# Altium schematic sheet pca20072_panel_breakout.SchDoc: =BoardTitle
size A4; Organization: Nordic Semiconductor; DocumentNumber: 4; SheetNumber: 4; SheetTotal: 6; CompanyName: Nordic Semiconductor; DocumentSize: A4
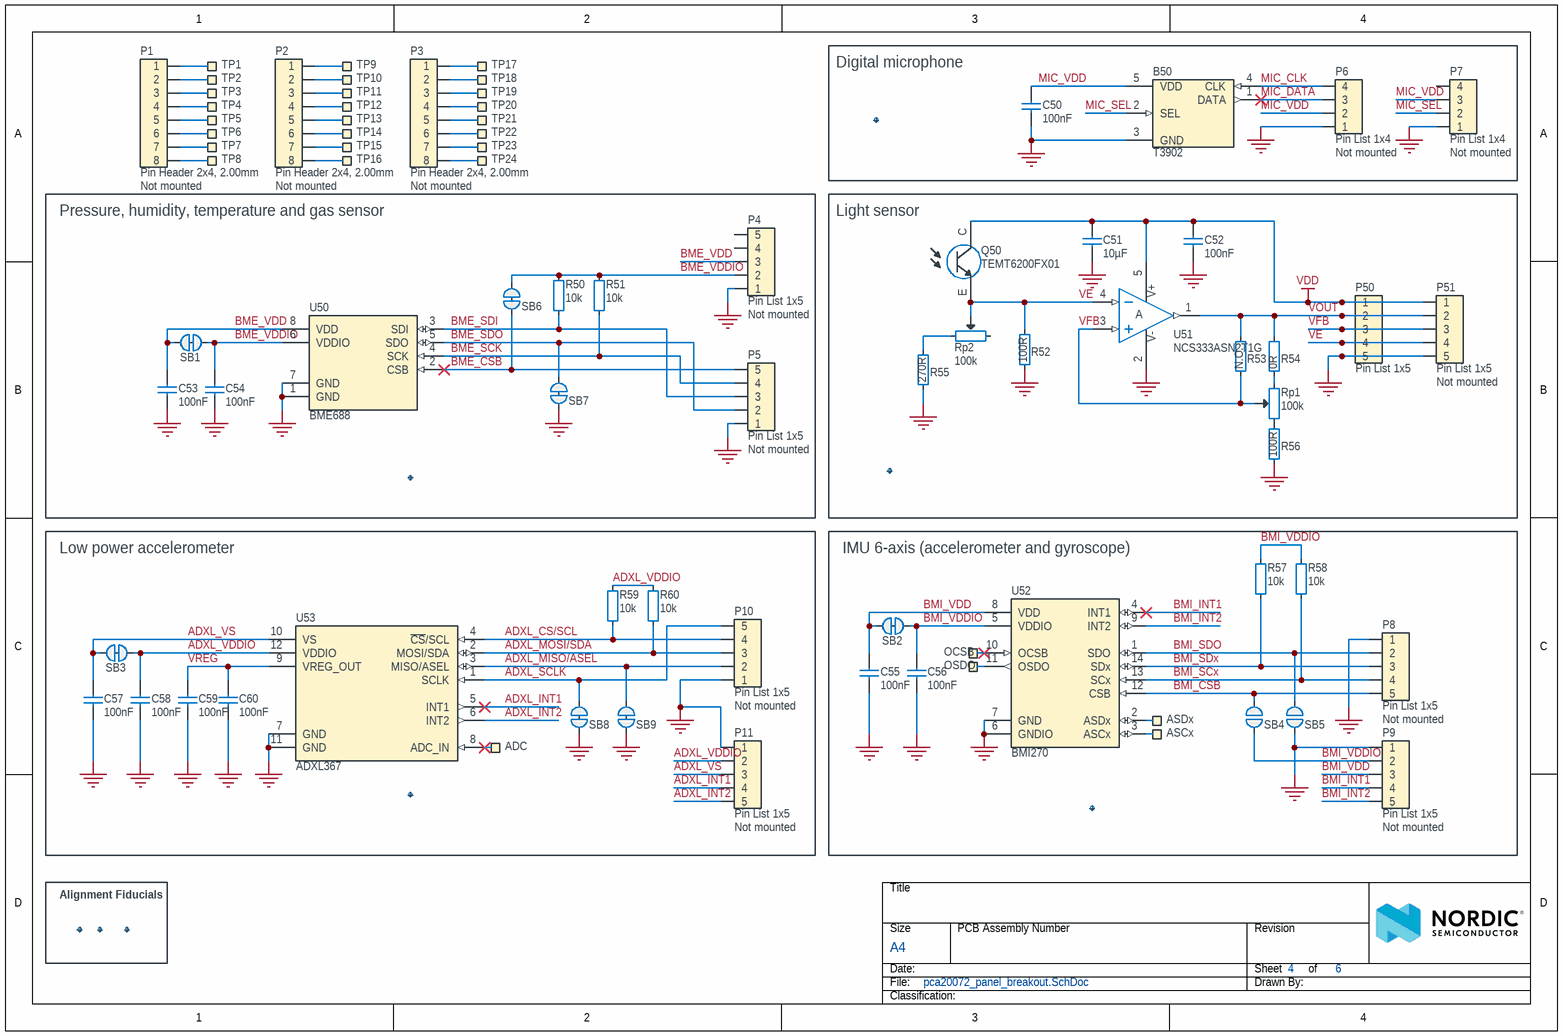
[diagram p0: pca20072_panel_breakout.SchDoc]

## Parts
ADC  Ø1.2mm,SMD  [TP_SMD_D1.2mm]  (value not drawn)  (no BOM)
ASCx  Ø1.2mm,SMD  [TP_SMD_D1.2mm]  (value not drawn)  (no BOM)
ASDx  Ø1.2mm,SMD  [TP_SMD_D1.2mm]  (value not drawn)  (no BOM)
B50  T3902  [T3902]
C50  100nF  [CAPC0603X03L_C]
C51  10µF  [CAPC1005X04L_C2]
C52  100nF  [CAPC0603X03L_C]
C53  100nF  [CAPC0603X03L_C]
C54  100nF  [CAPC0603X03L_C]
C55  100nF  [CAPC0603X03L_C]
C56  100nF  [CAPC0603X03L_C]
C57  100nF  [CAPC0603X03L_C]
C58  100nF  [CAPC0603X03L_C]
C59  100nF  [CAPC0603X03L_C]
C60  100nF  [CAPC0603X03L_C]
Fid50  Fiducial mark  [Fiducial]  (value not drawn)
Fid51  Fiducial mark  [Fiducial]  (value not drawn)
Fid52  Fiducial mark  [Fiducial]  (value not drawn)
Fid53  Fiducial mark  [Fiducial]  (value not drawn)
Fid54  Fiducial mark  [Fiducial]  (value not drawn)
Fid55  Fiducial mark  [Fiducial]  (value not drawn)
Fid56  Fiducial mark  [Fiducial]  (value not drawn)
Fid57  Fiducial mark  [Fiducial]  (value not drawn)
OCSB  Ø1.2mm,SMD  [TP_SMD_D1.2mm]  (value not drawn)  (no BOM)
OSDO  Ø1.2mm,SMD  [TP_SMD_D1.2mm]  (value not drawn)  (no BOM)
P1  Pin Header 2x4, 2.00mm  Assembly: Not mounted  [HDR_2x4_TH_2.00MM-NC]
P2  Pin Header 2x4, 2.00mm  Assembly: Not mounted  [HDR_2x4_TH_2.00MM-NC]
P3  Pin Header 2x4, 2.00mm  Assembly: Not mounted  [HDR_2x4_TH_2.00MM-NC]
P4  Pin List 1x5  Assembly: Not mounted  [LIST_1x5-NC]
P5  Pin List 1x5  Assembly: Not mounted  [LIST_1x5-NC]
P6  Pin List 1x4  Assembly: Not mounted  [LIST_1x4-NC]
P7  Pin List 1x4  Assembly: Not mounted  [LIST_1x4-NC]
P8  Pin List 1x5  Assembly: Not mounted  [LIST_1x5-NC]
P9  Pin List 1x5  Assembly: Not mounted  [LIST_1x5-NC]
P10  Pin List 1x5  Assembly: Not mounted  [LIST_1x5-NC]
P11  Pin List 1x5  Assembly: Not mounted  [LIST_1x5-NC]
P50  Pin List 1x5  [LIST_1x5_SMD]
P51  Pin List 1x5  Assembly: Not mounted  [LIST_1x5-NC]
Q50  TEMT6200FX01  [TEMT6200FX01]
R50  10k  [RESC1005X04L]
R51  10k  [RESC1005X04L]
R52  100R  [RESC1005X04L]
R53  N.C.  [RESC1005X04L_NC]
R54  0R  [RESC1005X04L]
R55  270R  [RESC1005X04L]
R56  100R  [RESC1005X04L]
R57  10k  [RESC1005X04L]
R58  10k  [RESC1005X04L]
R59  10k  [RESC1005X04L]
R60  10k  [RESC1005X04L]
Rp1  100k  [POT.TRIM_23B]
Rp2  100k  [POT.TRIM_23B]
SB1  Solderbridge  [Solderbridge_Shorted]  (value not drawn)  (net tie, no BOM)
SB2  Solderbridge  [Solderbridge_Shorted]  (value not drawn)  (net tie, no BOM)
SB3  Solderbridge  [Solderbridge_Shorted]  (value not drawn)  (net tie, no BOM)
SB4  Solderbridge  [Solderbridge]  (value not drawn)  (no BOM)
SB5  Solderbridge  [Solderbridge]  (value not drawn)  (no BOM)
SB6  Solderbridge  [Solderbridge_Shorted]  (value not drawn)  (net tie, no BOM)
SB7  Solderbridge  [Solderbridge_Shorted]  (value not drawn)  (net tie, no BOM)
SB8  Solderbridge  [Solderbridge_Shorted]  (value not drawn)  (net tie, no BOM)
SB9  Solderbridge  [Solderbridge_Shorted]  (value not drawn)  (net tie, no BOM)
TP1  TP  [TESTPAD-TH]  (value not drawn)  (no BOM)
TP2  TP  [TESTPAD-TH]  (value not drawn)  (no BOM)
TP3  TP  [TESTPAD-TH]  (value not drawn)  (no BOM)
TP4  TP  [TESTPAD-TH]  (value not drawn)  (no BOM)
TP5  TP  [TESTPAD-TH]  (value not drawn)  (no BOM)
TP6  TP  [TESTPAD-TH]  (value not drawn)  (no BOM)
TP7  TP  [TESTPAD-TH]  (value not drawn)  (no BOM)
TP8  TP  [TESTPAD-TH]  (value not drawn)  (no BOM)
TP9  TP  [TESTPAD-TH]  (value not drawn)  (no BOM)
TP10  TP  [TESTPAD-TH]  (value not drawn)  (no BOM)
TP11  TP  [TESTPAD-TH]  (value not drawn)  (no BOM)
TP12  TP  [TESTPAD-TH]  (value not drawn)  (no BOM)
TP13  TP  [TESTPAD-TH]  (value not drawn)  (no BOM)
TP14  TP  [TESTPAD-TH]  (value not drawn)  (no BOM)
TP15  TP  [TESTPAD-TH]  (value not drawn)  (no BOM)
TP16  TP  [TESTPAD-TH]  (value not drawn)  (no BOM)
TP17  TP  [TESTPAD-TH]  (value not drawn)  (no BOM)
TP18  TP  [TESTPAD-TH]  (value not drawn)  (no BOM)
TP19  TP  [TESTPAD-TH]  (value not drawn)  (no BOM)
TP20  TP  [TESTPAD-TH]  (value not drawn)  (no BOM)
TP21  TP  [TESTPAD-TH]  (value not drawn)  (no BOM)
TP22  TP  [TESTPAD-TH]  (value not drawn)  (no BOM)
TP23  TP  [TESTPAD-TH]  (value not drawn)  (no BOM)
TP24  TP  [TESTPAD-TH]  (value not drawn)  (no BOM)
U50  BME688  [BME680]
U51  NCS333ASN2T1G  [SOT95P275X110-5N]
U52  BMI270  [BMI270]
U53  ADXL367  [LGA50P220X230X97-12N]

## Blocks framed on the sheet
Digital microphone: B50 C50 Fid50 P6 P7
Pressure, humidity, temperature and gas sensor: C53 C54 Fid52 P4 P5 R50 R51 SB1 SB6 SB7 U50
Light sensor: C51 C52 Fid51 P50 P51 Q50 R52-R56 Rp1 Rp2 U51
Low power accelerometer: ADC C57-C60 Fid54 P10 P11 R59 R60 SB3 SB8 SB9 U53
IMU 6-axis (accelerometer and gyroscope): ASCx ASDx C55 C56 Fid53 OCSB OSDO P8 P9 R57 R58 SB2 SB4 SB5 U52
Alignment Fiducials: Fid55-Fid57

## Nets
GND: B50.3(GND) C50.1 C51.2 C52.2 C53.1 C54.1 C55.1 C56.1 C57.1 C58.1 C59.1 C60.1 P4.1 P5.1 P6.1 P7.1 P8.1 P9.1 P10.1 P11.1 P50.5 P51.5 R52.1 R55.1 R56.1 SB5.2 SB7.2 SB8.2 SB9.2 U50.1(GND) U50.7(GND) U51.2(VSS) U52.6(GNDIO) U52.7(GND) U53.7(GND) U53.11(GND)
VDD: C51.1 C52.1 P50.1 P51.1 Q50.C U51.5(VDD)
ADXL_CS/SCL: P10.4 R59.2 U53.4(~{CS}/SCL)
ADXL_INT1: P11.4 U53.5(INT1)
ADXL_INT2: P11.5 U53.6(INT2)
ADXL_MISO/ASEL: P10.2 SB9.1 U53.3(MISO/ASEL)
ADXL_MOSI/SDA: P10.3 R60.2 U53.2(MOSI/SDA)
ADXL_SCLK: P10.5 SB8.1 U53.1(SCLK)
ADXL_VDDIO: C58.2 P11.2 R59.1 R60.1 SB3.2 U53.12(VDDIO)
ADXL_VS: C57.2 P11.3 SB3.1 U53.10(VS)
BME_CSB: P5.5 SB6.1 U50.2(CSB)
BME_SCK: P5.4 R51.2 U50.4(SCK)
BME_SDI: P5.3 R50.2 U50.3(SDI)
BME_SDO: P5.2 SB7.1 U50.5(SDO)
BME_VDD: C53.2 P4.3 SB1.2 U50.8(VDD)
BME_VDDIO: C54.2 P4.2 R50.1 R51.1 SB1.1 SB6.2 U50.6(VDDIO)
BMI_CSB: P8.5 SB4.1 U52.12(CSB)
BMI_INT1: P9.4 U52.4(INT1)
BMI_INT2: P9.5 U52.9(INT2)
BMI_SCx: P8.4 R58.2 U52.13(SCx)
BMI_SDO: P8.2 SB5.1 U52.1(SDO)
BMI_SDx: P8.3 R57.2 U52.14(SDx)
BMI_VDD: C55.2 P9.3 SB2.1 U52.8(VDD)
BMI_VDDIO: C56.2 P9.2 R57.1 R58.1 SB2.2 SB4.2 U52.5(VDDIO)
MIC_CLK: B50.4(CLK) P6.4
MIC_DATA: B50.1(DATA) P6.3
MIC_SEL: B50.2(SEL) P7.2
MIC_VDD: B50.5(VDD) C50.2 P6.2 P7.3
VE: P50.4 P51.4 Q50.E R52.2 Rp2.3 U51.4(IN-)
VFB: P50.3 P51.3 R53.1 Rp1.3 U51.3(IN+)
VOUT: P50.2 P51.2 R53.2 R54.2 U51.1(OUT)
VREG: C59.2 C60.2 U53.9(VREG_OUT)
NetADC_1: ADC.1 U53.8(ADC_IN)
NetASCx_1: ASCx.1 U52.3(ASCx)
NetASDx_1: ASDx.1 U52.2(ASDx)
NetOCSB_1: OCSB.1 U52.10(OCSB)
NetOSDO_1: OSDO.1 U52.11(OSDO)
NetP1_1: P1.1 TP1.1
NetP1_2: P1.2 TP2.1
NetP1_3: P1.3 TP3.1
NetP1_4: P1.4 TP4.1
NetP1_5: P1.5 TP5.1
NetP1_6: P1.6 TP6.1
NetP1_7: P1.7 TP7.1
NetP1_8: P1.8 TP8.1
NetP2_1: P2.1 TP9.1
NetP2_2: P2.2 TP10.1
NetP2_3: P2.3 TP11.1
NetP2_4: P2.4 TP12.1
NetP2_5: P2.5 TP13.1
NetP2_6: P2.6 TP14.1
NetP2_7: P2.7 TP15.1
NetP2_8: P2.8 TP16.1
NetP3_1: P3.1 TP17.1
NetP3_2: P3.2 TP18.1
NetP3_3: P3.3 TP19.1
NetP3_4: P3.4 TP20.1
NetP3_5: P3.5 TP21.1
NetP3_6: P3.6 TP22.1
NetP3_7: P3.7 TP23.1
NetP3_8: P3.8 TP24.1
NetR54_1: R54.1 Rp1.1
NetR55_2: R55.2 Rp2.2
NetR56_2: R56.2 Rp1.2

Not connected (* = marked no-connect by the designer): P4 4 5; P7 4; Rp2 1

## Notes on the sheet
- Title
- Size
- Date:
- File:
- A4
- PCB Assembly Number
- Drawn By:
- Revision
- Sheet
- of
- Classification:
- (in symbol NCS333ASN2T1G) V+; A; V-

## Library data of the parts
ADC ASCx ASDx OCSB OSDO = TP_SMD_Ø1.2MM: 1.2mm circular SMD testpad; Manufacturer: Nordic Semiconductor; Manufacturer Part Number: N.A.; Part number NEMS: 100500476; Component Status: Active; Pad Count: 1; Part Number: TP_SMD_Ø1.2MM; PartId: 100500476; Component Class: Connectors; Author: rsk; ComponentLink1URL: N.A.; ComponentLink1Description: Datasheet; ComponentLink2URL: N.A.; ComponentLink2Description: Supplier link; HelpURL: N.A.; LatestRevisionDate: 2021-03-05; Published: 2019-10-09; Footprint Doc: TP_SMD_Ø1.2mm; Value: Ø1.2mm,SMD; Note: N.A.; Supplier 1: N.A.; Supplier Part Number 1: N.A.; Supplier 2: N.A.; Supplier Part Number 2: N.A.; Artikkelnr Noca: N.A.; Part number IPS: N.A.; Part number Norautron: N.A.
B50 = MMICT3902‐00‐012: Bottom Port PDM Low‐Power Multi‐Mode Microphone With High AOP Mode; Manufacturer: TDK Corporation; Part number NEMS: 101900855; Component Status: Active; Pad Count: 5; Note: N.A.; Part Number: MMICT3902‐00‐012; Component Class: Misc_ICs; Author: rubr; Manufacturer Part Number: MMICT3902‐00‐012; ComponentLink1URL: https://invensense.tdk.com/wp-content/uploads/2020/05/DS-000357-T3902-v1.0.pdf; ComponentLink1Description: Datasheet; ComponentLink2URL: https://www.digikey.com/en/products/detail/tdk-invensense/MMICT390200012/12746024; ComponentLink2Description: Supplier link; HelpURL: https://invensense.tdk.com/products/digital/t3902/; LatestRevisionDate: 2025-01-30; Published: 2025-01-30; Footprint Doc: T3902; Value: T3902; Supplier 1: Digi-Key; Supplier Part Number 1: 1428-MMICT390200012CT-ND; Supplier 2: N.A.; Supplier Part Number 2: N.A.; Artikkelnr Noca: N.A.; Part number IPS: N.A.; Part number Norautron: N.A.; PartId: 101900855
C50 C53 C54 C57-C60 = C0201-100n: Capacitor, X5R, ±10%, 100nF, 16V; Manufacturer: N.A.; Part number IPS: 00000001248, 00000002505; Part number Norautron: 262071862; Part number NEMS: 100200078; Component Status: Active; Pad Count: 2; Part Number: C0201-100n; Manufacturer Part Number: N.A.; Footprint Doc: 0201; LatestRevisionDate: 2024-06-27; Published: 2014-11-13; Value: 100nF; Note: 16V; Artikkelnr Noca: N.A.; ComponentLink1URL: N.A.; ComponentLink1Description: Datasheet; ComponentLink2URL: N.A.; ComponentLink2Description: Supplier link; HelpURL: N.A.; Supplier 1: N.A.; Supplier Part Number 1: N.A.; Supplier 2: N.A.; Supplier Part Number 2: N.A.; PartId: 100200078; Component Class: Capacitors; Author: rsk
C51 = C0402-10µ-6.3V-X5R-GRM155R60J106ME05D: Capacitor, X5R, ±20%, 6.3V; Manufacturer: Murata; Part number NEMS: 100200554; Pad Count: 2; Artikkelnr Noca: N.A.; Component Status: Active; Part Number: C0402-10µ-6.3V-X5R-GRM155R60J106ME05D; PartId: 100200554; Component Class: Capacitors; Author: eisk; Manufacturer Part Number: GRM155R60J106ME05D; ComponentLink1URL: https://www.murata.com/products/productdetail?partno=GRM155R60J106ME05%23; ComponentLink1Description: Datasheet; ComponentLink2URL: N.A.; ComponentLink2Description: Supplier link; HelpURL: https://www.murata.com/products/productdetail?partno=GRM155R60J106ME05%23; Footprint Doc: 0402; LatestRevisionDate: 2023-08-01; Published: 2023-08-01; Value: 10µF; Note: 6.3V; Supplier 1: Digi-Key; Supplier Part Number 1: 490-GRM155R60J106ME05DTR-ND; Supplier 2: Mouser; Supplier Part Number 2: 81-GRM155C81C225KE1D; Part number IPS: N.A.; Part number Norautron: N.A.
C52 C55 C56 = C0201-100n: Capacitor, X5R, ±10%, 100nF, 16V; Manufacturer: N.A.; Part number IPS: 00000001248, 00000002505; Part number Norautron: 262071862; Part number NEMS: 100200078; Pad Count: 2; Component Status: Active; Part Number: C0201-100n; PartId: 100200078; Component Class: Capacitors; Author: rsk; Manufacturer Part Number: N.A.; ComponentLink1URL: N.A.; ComponentLink1Description: Datasheet; ComponentLink2URL: N.A.; ComponentLink2Description: Supplier link; HelpURL: N.A.; Footprint Doc: 0201; LatestRevisionDate: 2024-06-27; Published: 2014-11-13; Value: 100nF; Note: 16V; Supplier 1: N.A.; Supplier Part Number 1: N.A.; Supplier 2: N.A.; Supplier Part Number 2: N.A.; Artikkelnr Noca: N.A.
Fid50-Fid57 = Fid-Mark: Manufacturer: N.A.; Part number NEMS: 100500073; Value: N.A.; Pad Count: 1; Component Status: Active; System: Connector; Part Number: Fid-Mark; Manufacturer Part Number: N.A.; LatestRevisionDate: 2009-12-12; Published: 2009-12-12; Note: N.A.; Artikkelnr Noca: N.A.; Footprint Doc: Fiducial; PartId: 100500073; Component Class: Connectors; Author: rsk; ComponentLink1URL: N.A.; ComponentLink1Description: Datasheet; ComponentLink2URL: N.A.; ComponentLink2Description: Supplier link; HelpURL: N.A.; Supplier 1: N.A.; Supplier Part Number 1: N.A.; Supplier 2: N.A.; Supplier Part Number 2: N.A.; Part number IPS: N.A.; Part number Norautron: N.A.
P1-P3 = Pin Header 2x4 TH, 2.00mm, N.C.: Pin Header 2x4, TH, 2.00mm; Manufacturer: N.A.; Part number NEMS: 100500252; Component Status: Active; Pad Count: 6; System: Connector; Part Number: Pin Header 2x4 TH, 2.00mm, N.C.; PartId: 100500252; Component Class: Connectors; Author: rsk; Manufacturer Part Number: N.A.; ComponentLink1URL: N.A.; ComponentLink1Description: Datasheet; ComponentLink2URL: N.A.; ComponentLink2Description: Supplier link; HelpURL: N.A.; LatestRevisionDate: 2019-01-21; Published: 2019-01-21; Footprint Doc: HDR_2x4_TH_2.00MM-NC; Value: Pin Header 2x4, 2.00mm; Note: N.A.; Supplier 1: N.A.; Supplier Part Number 1: N.A.; Supplier 2: N.A.; Supplier Part Number 2: N.A.; Artikkelnr Noca: N.A.; Part number IPS: N.A.; Part number Norautron: N.A.
P4 P5 P8-P11 P51 = Pin List 1x5, N.C.: Pin List 1x5, 2.54mm (100mil); Manufacturer: N.A.; Part number NEMS: 100500315; Component Status: Active; Pad Count: 5; System: Connector; Part Number: Pin List 1x5, N.C.; PartId: 100500315; Component Class: Connectors; Author: rsk; Manufacturer Part Number: N.A.; ComponentLink1URL: N.A.; ComponentLink1Description: Datasheet; ComponentLink2URL: N.A.; ComponentLink2Description: Supplier link; HelpURL: N.A.; LatestRevisionDate: 2017-10-23; Published: 2017-10-23; Footprint Doc: LIST_1x5; Value: Pin List 1x5; Note: N.A.; Supplier 1: N.A.; Supplier Part Number 1: N.A.; Supplier 2: N.A.; Supplier Part Number 2: N.A.; Artikkelnr Noca: N.A.; Part number IPS: N.A.; Part number Norautron: N.A.
P6 P7 = Pin List 1x4, N.C.: Pin List 1x4, 2.54mm (100mil); Manufacturer: N.A.; Part number NEMS: 100500310; Component Status: Active; Pad Count: 4; System: Connector; Part Number: Pin List 1x4, N.C.; PartId: 100500310; Component Class: Connectors; Author: rsk; Manufacturer Part Number: N.A.; ComponentLink1URL: N.A.; ComponentLink1Description: Datasheet; ComponentLink2URL: N.A.; ComponentLink2Description: Supplier link; HelpURL: N.A.; LatestRevisionDate: 2017-10-23; Published: 2017-10-23; Footprint Doc: LIST_1x4; Value: Pin List 1x4; Note: N.A.; Supplier 1: N.A.; Supplier Part Number 1: N.A.; Supplier 2: N.A.; Supplier Part Number 2: N.A.; Artikkelnr Noca: N.A.; Part number IPS: N.A.; Part number Norautron: N.A.
P50 = Pin List 1x5 SMD: Pin List 1x5, 2.54mm (100mil), SMD; Manufacturer: WCON; Manufacturer Part Number: 1125-1105S0M116R1; Part number NEMS: 100500316; Component Status: Active; Pad Count: 5; Note: N.A.; System: Connector; Part Number: Pin List 1x5 SMD; PartId: 100500316; Component Class: Connectors; Author: rsk; ComponentLink1URL: \\hizz\pro\app9717\Datasheet\connectors\W-CON\1125-11XXXXMXXXXX.pdf; ComponentLink1Description: Datasheet; ComponentLink2URL: N.A.; ComponentLink2Description: Supplier link; HelpURL: \\hizz\pro\app9717\Datasheet\connectors\W-CON\1125-11XXXXMXXXXX.pdf; LatestRevisionDate: 2023-03-08; Published: 2014-02-03; Footprint Doc: LIST_1x5_SMD; Value: Pin List 1x5; Supplier 1: Cabcon; Supplier Part Number 1: 1125-1105S0M116R1; Supplier 2: Samtec; Supplier Part Number 2: TSM-105-01-L-SV-P-TR; Artikkelnr Noca: N.A.; Part number IPS: N.A.; Part number Norautron: N.A.
Q50 = TEMT6200FX01: Phototransistors 550nm Top View 0805 (2012 Metric); Manufacturer: Vishay Semiconductor Opto Division; Part number NEMS: 101400145; Component Status: Active; Pad Count: 2; Note: N.A.; Part Number: TEMT6200FX01; PartId: 101400145; Component Class: Optoelectronics; Author: getr; Manufacturer Part Number: TEMT6200FX01; ComponentLink1URL: https://www.vishay.com/docs/81317/temt6200.pdf; ComponentLink1Description: Datasheet; ComponentLink2URL: https://www.digikey.no/en/products/detail/vishay-semiconductor-opto-division/TEMT6200FX01/1681190?s=N4IgTCBcDaICoFECycBsYAMGBiANDAjAAQgC6AvkA; ComponentLink2Description: Supplier link; HelpURL: https://www.vishay.com/en/product/81317/; LatestRevisionDate: 2023-11-07; Published: 2023-11-07; Footprint Doc: N.A.; Value: TEMT6200FX01; Supplier 1: Digi-Key; Supplier Part Number 1: 751-1056-1-ND; Supplier 2: N.A.; Supplier Part Number 2: N.A.; Artikkelnr Noca: N.A.; Part number IPS: N.A.; Part number Norautron: N.A.
R50 R51 R57-R60 = R0402-10k: Resistor, ±1%, 0.063W; Manufacturer: N.A.; Part number IPS: 00000002093; Part number NEMS: 100100198; Component Status: Active; Pad Count: 2; Note: Chip Res 1%; Artikkelnr Noca: 27049097; Part Number: R0402-10k; PartId: 100100198; Component Class: Resistors; Author: rsk; Manufacturer Part Number: N.A.; ComponentLink1URL: N.A.; ComponentLink1Description: Datasheet; ComponentLink2URL: N.A.; ComponentLink2Description: Supplier link; HelpURL: N.A.; LatestRevisionDate: 2009-11-23; Published: 2009-05-08; Footprint Doc: 0402; Value: 10k; Supplier 1: Farnell; Supplier Part Number 1: 173-8864; Supplier 2: N.A.; Supplier Part Number 2: N.A.; Part number Norautron: N.A.
R52 R56 = R0402-100: Resistor, ±1%, 0.063W; Manufacturer: N.A.; Part number IPS: 00000002811; Part number NEMS: 100100148; Component Status: Active; Pad Count: 2; Note: Chip Res 1%; Artikkelnr Noca: 27049049; Part Number: R0402-100; PartId: 100100148; Component Class: Resistors; Author: rsk; Manufacturer Part Number: N.A.; ComponentLink1URL: N.A.; ComponentLink1Description: Datasheet; ComponentLink2URL: N.A.; ComponentLink2Description: Supplier link; HelpURL: N.A.; LatestRevisionDate: 2009-11-23; Published: 2009-05-08; Footprint Doc: 0402; Value: 100R; Supplier 1: Farnell; Supplier Part Number 1: 173-8837; Supplier 2: N.A.; Supplier Part Number 2: N.A.; Part number Norautron: N.A.
R53 = R0402-N.C.: Not mounted; Manufacturer: N.A.; Part number NEMS: 100100281; Component Status: Active; Pad Count: 2; Note: Chip Res; Assembly: Not mounted; Part Number: R0402-N.C.; PartId: 100100281; Component Class: Resistors; Author: rsk; Manufacturer Part Number: N.A.; ComponentLink1URL: N.A.; ComponentLink1Description: Datasheet; ComponentLink2URL: N.A.; ComponentLink2Description: Supplier link; HelpURL: N.A.; LatestRevisionDate: 2009-05-08; Published: 2009-05-08; Footprint Doc: 0402; Value: N.C.; Supplier 1: N.A.; Supplier Part Number 1: N.A.; Supplier 2: N.A.; Supplier Part Number 2: N.A.; Artikkelnr Noca: N.A.; Part number IPS: N.A.; Part number Norautron: N.A.
R54 = R0402-0R: Resistor, ±5%, 0.063W; Manufacturer: N.A.; Part number IPS: 00000007128; Part number NEMS: 100100109; Component Status: Active; Pad Count: 2; Note: Chip Res 5%; Artikkelnr Noca: 27049000; Part Number: R0402-0R; PartId: 100100109; Component Class: Resistors; Author: rsk; Manufacturer Part Number: N.A.; ComponentLink1URL: N.A.; ComponentLink1Description: Datasheet; ComponentLink2URL: N.A.; ComponentLink2Description: Supplier link; HelpURL: N.A.; LatestRevisionDate: 2009-11-23; Published: 2009-05-08; Footprint Doc: 0402; Value: 0R; Supplier 1: Farnell; Supplier Part Number 1: 146-9661; Supplier 2: N.A.; Supplier Part Number 2: N.A.; Part number Norautron: N.A.
R55 = R0402-270: Resistor, ±1%, 0.063W; Manufacturer: N.A.; Part number NEMS: 100100158; Component Status: Active; Pad Count: 2; Note: Chip Res 1%; Artikkelnr Noca: 27049059; Part Number: R0402-270; PartId: 100100158; Component Class: Resistors; Author: rsk; Manufacturer Part Number: N.A.; ComponentLink1URL: N.A.; ComponentLink1Description: Datasheet; ComponentLink2URL: N.A.; ComponentLink2Description: Supplier link; HelpURL: N.A.; LatestRevisionDate: 2009-11-23; Published: 2009-05-08; Footprint Doc: 0402; Value: 270R; Supplier 1: Farnell; Supplier Part Number 1: 173-8842; Supplier 2: N.A.; Supplier Part Number 2: N.A.; Part number IPS: N.A.; Part number Norautron: N.A.
Rp1 Rp2 = Trimpot_23B_100k: BI techolygies, CB10V Series trim.pot; Manufacturer: N.A.; Part number NEMS: 100100516; Component Status: Active; Pad Count: 3; Part Number: Trimpot_23B_100k; PartId: 100100516; Component Class: Resistors; Author: rsk; Manufacturer Part Number: N.A.; ComponentLink1URL: N.A.; ComponentLink1Description: Datasheet; ComponentLink2URL: N.A.; ComponentLink2Description: Supplier link; HelpURL: N.A.; LatestRevisionDate: 2013-08-28; Published: 2013-08-28; Footprint Doc: POT.TRIM_23B; Value: 100k; Note: BI techolygies, CB10V Series trim.pot; Supplier 1: Digi-Key; Supplier Part Number 1: 987-1013-1-ND; Supplier 2: N.A.; Supplier Part Number 2: N.A.; Artikkelnr Noca: N.A.; Part number IPS: N.A.; Part number Norautron: N.A.
SB1-SB3 SB6-SB9 = Solderbridge Shorted: Shorted Solderbridge; Manufacturer: N.A.; Part number NEMS: 100500459; Component Status: Active; Pad Count: 2; System: Connector; Part Number: Solderbridge Shorted; PartId: 100500459; Component Class: Connectors; Author: rsk; Manufacturer Part Number: N.A.; ComponentLink1URL: N.A.; ComponentLink1Description: Datasheet; ComponentLink2URL: N.A.; ComponentLink2Description: Supplier link; HelpURL: N.A.; LatestRevisionDate: 2012-08-07; Published: 2012-08-07; Footprint Doc: Solderbridge_Shorted; Value: Solderbridge; Note: N.A.; Supplier 1: N.A.; Supplier Part Number 1: N.A.; Supplier 2: N.A.; Supplier Part Number 2: N.A.; Artikkelnr Noca: N.A.; Part number IPS: N.A.; Part number Norautron: N.A.
SB4 SB5 = Solderbridge: Manufacturer: N.A.; Part number NEMS: 100500458; Component Status: Active; Pad Count: 2; System: Connector; Part Number: Solderbridge; PartId: 100500458; Component Class: Connectors; Author: rsk; Manufacturer Part Number: N.A.; ComponentLink1URL: N.A.; ComponentLink1Description: Datasheet; ComponentLink2URL: N.A.; ComponentLink2Description: Supplier link; HelpURL: N.A.; LatestRevisionDate: 2009-12-14; Published: 2009-12-14; Footprint Doc: Solderbridge; Value: Solderbridge; Note: N.A.; Supplier 1: N.A.; Supplier Part Number 1: N.A.; Supplier 2: N.A.; Supplier Part Number 2: N.A.; Artikkelnr Noca: N.A.; Part number IPS: N.A.; Part number Norautron: N.A.
TP1-TP24 = Testpoint TH: Testpoint, through hole; Manufacturer: N.A.; Part number NEMS: 100500464; Component Status: Active; Pad Count: 1; Part Number: Testpoint TH; PartId: 100500464; Component Class: Connectors; Author: rsk; Manufacturer Part Number: N.A.; ComponentLink1URL: N.A.; ComponentLink1Description: Datasheet; ComponentLink2URL: N.A.; ComponentLink2Description: Supplier link; HelpURL: N.A.; LatestRevisionDate: 2009-12-12; Published: 2009-12-12; Footprint Doc: TESTPAD-TH; Value: TP; Note: N.A.; Supplier 1: N.A.; Supplier Part Number 1: N.A.; Supplier 2: N.A.; Supplier Part Number 2: N.A.; Artikkelnr Noca: N.A.; Part number IPS: N.A.; Part number Norautron: N.A.
U50 = BME688: Low power gas, pressure, temperature & humidity sensor; Manufacturer: Bosch; Part number NEMS: 101900619; Component Status: Active; Pad Count: 8; Note: N.A.; Part Number: BME688; PartId: 101900619; Component Class: Misc_ICs; Author: rsk; Manufacturer Part Number: BME688; ComponentLink1URL: https://www.bosch-sensortec.com/media/boschsensortec/downloads/datasheets/bst-bme688-ds000.pdf; ComponentLink1Description: Datasheet; ComponentLink2Description: Supplier link; HelpURL: https://www.bosch-sensortec.com/products/environmental-sensors/gas-sensors/bme688/; LatestRevisionDate: 2024-10-03; Published: 2020-07-07; Footprint Doc: LGA-8; Value: BME688; Supplier 1: Digi-Key; Supplier Part Number 1: 828-BME688TR-ND; Supplier 2: N.A.; Supplier Part Number 2: N.A.; Artikkelnr Noca: N.A.; Part number IPS: N.A.; Part number Norautron: N.A.
U51 = NCS333ASN2T1G: Low Power, Zero-Drift Operational Amplifier; Manufacturer: Onsemi; Part number NEMS: 101900755; Pad Count: 5; Note: N.A.; Component Status: Active; Part Number: NCS333ASN2T1G; PartId: 101900755; Component Class: Misc_ICs; Author: daba; Manufacturer Part Number: NCS333ASN2T1G; ComponentLink1URL: https://www.onsemi.com/download/data-sheet/pdf/ncs333-d.pdf; ComponentLink1Description: Datasheet; ComponentLink2URL: https://www.onsemi.com/products/signal-conditioning-control/amplifiers-comparators/operational-amplifiers-op-amps/ncs333; ComponentLink2Description: Supplier link; HelpURL: N.A.; Footprint Doc: SOT-23-5; LatestRevisionDate: 2023-01-05; Published: 2023-01-05; Value: NCS333ASN2T1G; Supplier 1: Digi-Key; Supplier Part Number 1: NCS333ASN2T1GOSCT-ND; Supplier 2: Mouser; Supplier Part Number 2: 863-NCS333ASN2T1G; Artikkelnr Noca: N.A.; Part number IPS: N.A.; Part number Norautron: N.A.
U52 = BMI270: 6-axis, smart, low-power, inertial measurement unit; Manufacturer: Bosch; Part number NEMS: 101900620; Note: N.A.; Pad Count: 14; Component Status: Active; Part Number: BMI270; Manufacturer Part Number: BMI270; ComponentLink1URL: https://www.bosch-sensortec.com/media/boschsensortec/downloads/datasheets/bst-bmi270-ds000.pdf; ComponentLink1Description: Datasheet; ComponentLink2URL: https://www.bosch-sensortec.com/products/motion-sensors/imus/bmi270.html; ComponentLink2Description: Supplier link; HelpURL: https://www.bosch-sensortec.com/media/boschsensortec/downloads/datasheets/bst-bmi270-ds000.pdf; Footprint Doc: LGA-14; LatestRevisionDate: 2021-08-03; Published: 2020-07-07; Value: BMI270; Supplier 1: Digi-Key; Supplier Part Number 1: 828-1091-1-ND; Supplier 2: Mouser; Supplier Part Number 2: 262-BMI270; Artikkelnr Noca: N.A.; Part number IPS: N.A.; Component Class: Misc_ICs; PartId: 101900620; Author: rsk; Part number Norautron: N.A.
U53 = ADXL367BCCZ: Micropower, 3-Axis, ±2 g/±4 g/±8 g Digital Output MEMS Accelerometer; Manufacturer: Analog Devices; Part number NEMS: 101900775; Note: N.A.; Component Status: Active; Pad Count: 12; Part Number: ADXL367BCCZ; Manufacturer Part Number: ADXL367BCCZ; ComponentLink1URL: http://www.analog.com/media/en/technical-documentation/data-sheets/ADXL367.pdf; ComponentLink1Description: Datasheet; ComponentLink2URL: https://www.digikey.com/en/products/detail/analog-devices-inc/ADXL367BCCZ-RL7/16360579; ComponentLink2Description: Supplier link; HelpURL: http://www.analog.com/en/products/ADXL367.html; Footprint Doc: LGA-12; LatestRevisionDate: 2023-04-03; Published: 2023-04-03; Value: ADXL367; Supplier 1: Digi-Key; Supplier Part Number 1: 505-ADXL367BCCZ-RL7CT-ND; Supplier 2: Mouser; Supplier Part Number 2: 584-ADXL367BCCZ-RL7; Artikkelnr Noca: N.A.; Part number IPS: N.A.; Component Class: Misc_ICs; Author: rubr; Part number Norautron: N.A.; PartId: 101900775